# Altium schematic sheet DDRC_Sheet_2.SchDoc
size A4; DocumentNumber: 10; SheetNumber: 10; SheetTotal: 27
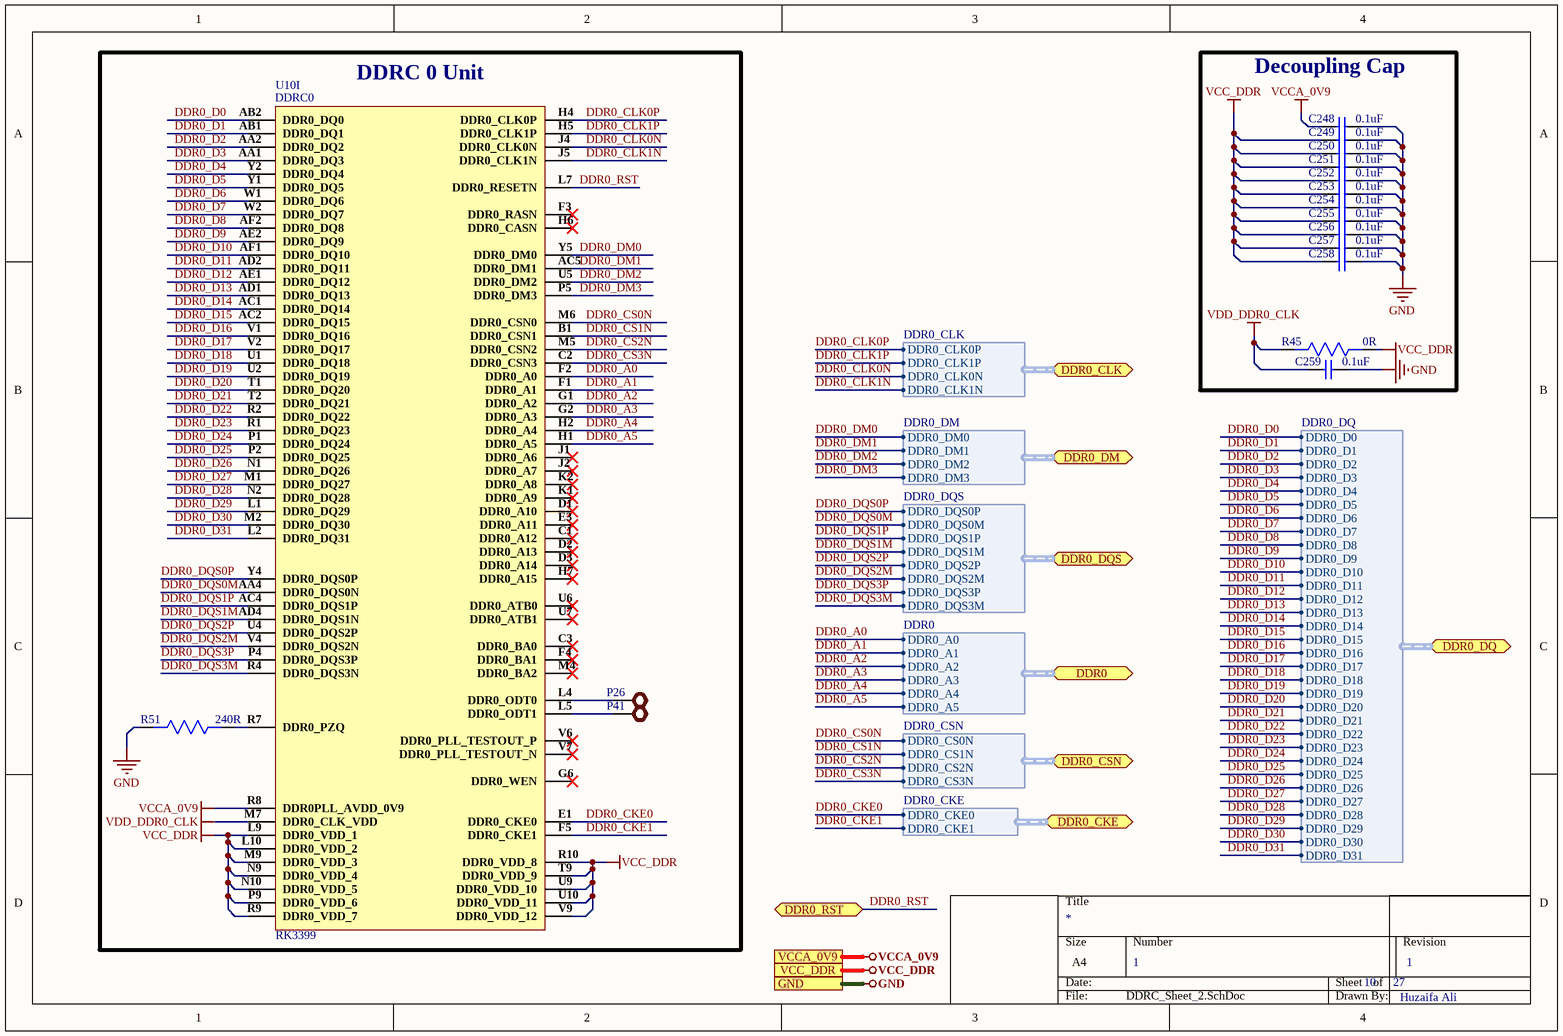
[diagram p0: DDRC_Sheet_2.SchDoc]

## Parts
C248  0.1uF  [Cap0402]
C249  0.1uF  [Cap0402]
C250  0.1uF  [Cap0402]
C251  0.1uF  [Cap0402]
C252  0.1uF  [Cap0402]
C253  0.1uF  [Cap0402]
C254  0.1uF  [Cap0402]
C255  0.1uF  [Cap0402]
C256  0.1uF  [Cap0402]
C257  0.1uF  [Cap0402]
C258  0.1uF  [Cap0402]
C259  0.1uF  [Cap0402]
P26  TEST POINT  [TEST POINT]  (value not drawn)
P41  TEST POINT  [TEST POINT]  (value not drawn)
R45  0R  [Res0603]
R51  240R  [Res0603]
U10  RK3399  [RK3399]  (part I of 34)

## Blocks framed on the sheet
DDRC 0 Unit: P26 P41 R51 U10
Decoupling Cap: C248-C259 R45

## Ports
DDR0 (bidir, harness DDR0), DDR0_CKE (bidir, harness DDR0_CKE), DDR0_CLK (bidir, harness DDR0_CLK), DDR0_CSN (bidir, harness DDR0_CSN), DDR0_DM (bidir, harness DDR0_DM), DDR0_DQ (bidir, harness DDR0_DQ), DDR0_DQS (bidir, harness DDR0_DQS), DDR0_RST (bidir), GND, VCC_DDR, VCCA_0V9

## Harnesses
DDR0_DQ: DDR0_D0, DDR0_D1, DDR0_D2, DDR0_D3, DDR0_D4, DDR0_D5, DDR0_D6, DDR0_D7, DDR0_D8, DDR0_D9, DDR0_D10, DDR0_D11, DDR0_D12, DDR0_D13, DDR0_D14, DDR0_D15, DDR0_D16, DDR0_D17, DDR0_D18, DDR0_D19, DDR0_D20, DDR0_D21, DDR0_D22, DDR0_D23, DDR0_D24, DDR0_D25, DDR0_D26, DDR0_D27, DDR0_D28, DDR0_D29, DDR0_D30, DDR0_D31
DDR0_DM: DDR0_DM0, DDR0_DM1, DDR0_DM2, DDR0_DM3
DDR0_DQS: DDR0_DQS0P, DDR0_DQS0M, DDR0_DQS1P, DDR0_DQS1M, DDR0_DQS2P, DDR0_DQS2M, DDR0_DQS3P, DDR0_DQS3M
DDR0: DDR0_A0, DDR0_A1, DDR0_A2, DDR0_A3, DDR0_A4, DDR0_A5
DDR0_CSN: DDR0_CS0N, DDR0_CS1N, DDR0_CS2N, DDR0_CS3N
DDR0_CKE: DDR0_CKE0, DDR0_CKE1
DDR0_CLK: DDR0_CLK0P, DDR0_CLK1P, DDR0_CLK0N, DDR0_CLK1N

## Nets
GND: C248.2 C249.2 C250.2 C251.2 C252.2 C253.2 C254.2 C255.2 C256.2 C257.2 C258.2 C259.2 R51.2 ; port GND
VCC_DDR: C249.1 C250.1 C251.1 C252.1 C253.1 C254.1 C255.1 C256.1 C257.1 C258.1 R45.1 U10.L9(DDR0_VDD_1) U10.L10(DDR0_VDD_2) U10.M9(DDR0_VDD_3) U10.N9(DDR0_VDD_4) U10.N10(DDR0_VDD_5) U10.P9(DDR0_VDD_6) U10.R9(DDR0_VDD_7) U10.R10(DDR0_VDD_8) U10.T9(DDR0_VDD_9) U10.U9(DDR0_VDD_10) U10.U10(DDR0_VDD_11) U10.V9(DDR0_VDD_12) ; port VCC_DDR
VCCA_0V9: C248.1 U10.R8(DDR0PLL_AVDD_0V9) ; port VCCA_0V9
VDD_DDR0_CLK: C259.1 R45.2 U10.M7(DDR0_CLK_VDD)
DDR0_A0: U10.F2(DDR0_A0) ; port DDR0.DDR0_A0
DDR0_A1: U10.F1(DDR0_A1) ; port DDR0.DDR0_A1
DDR0_A2: U10.G1(DDR0_A2) ; port DDR0.DDR0_A2
DDR0_A3: U10.G2(DDR0_A3) ; port DDR0.DDR0_A3
DDR0_A4: U10.H2(DDR0_A4) ; port DDR0.DDR0_A4
DDR0_A5: U10.H1(DDR0_A5) ; port DDR0.DDR0_A5
DDR0_CKE0: U10.E1(DDR0_CKE0) ; port DDR0_CKE.DDR0_CKE0
DDR0_CKE1: U10.F5(DDR0_CKE1) ; port DDR0_CKE.DDR0_CKE1
DDR0_CLK0N: U10.J4(DDR0_CLK0N) ; port DDR0_CLK.DDR0_CLK0N
DDR0_CLK0P: U10.H4(DDR0_CLK0P) ; port DDR0_CLK.DDR0_CLK0P
DDR0_CLK1N: U10.J5(DDR0_CLK1N) ; port DDR0_CLK.DDR0_CLK1N
DDR0_CLK1P: U10.H5(DDR0_CLK1P) ; port DDR0_CLK.DDR0_CLK1P
DDR0_CS0N: U10.M6(DDR0_CSN0) ; port DDR0_CSN.DDR0_CS0N
DDR0_CS1N: U10.B1(DDR0_CSN1) ; port DDR0_CSN.DDR0_CS1N
DDR0_CS2N: U10.M5(DDR0_CSN2) ; port DDR0_CSN.DDR0_CS2N
DDR0_CS3N: U10.C2(DDR0_CSN3) ; port DDR0_CSN.DDR0_CS3N
DDR0_D0: U10.AB2(DDR0_DQ0) ; port DDR0_DQ.DDR0_D0
DDR0_D1: U10.AB1(DDR0_DQ1) ; port DDR0_DQ.DDR0_D1
DDR0_D2: U10.AA2(DDR0_DQ2) ; port DDR0_DQ.DDR0_D2
DDR0_D3: U10.AA1(DDR0_DQ3) ; port DDR0_DQ.DDR0_D3
DDR0_D4: U10.Y2(DDR0_DQ4) ; port DDR0_DQ.DDR0_D4
DDR0_D5: U10.Y1(DDR0_DQ5) ; port DDR0_DQ.DDR0_D5
DDR0_D6: U10.W1(DDR0_DQ6) ; port DDR0_DQ.DDR0_D6
DDR0_D7: U10.W2(DDR0_DQ7) ; port DDR0_DQ.DDR0_D7
DDR0_D8: U10.AF2(DDR0_DQ8) ; port DDR0_DQ.DDR0_D8
DDR0_D9: U10.AE2(DDR0_DQ9) ; port DDR0_DQ.DDR0_D9
DDR0_D10: U10.AF1(DDR0_DQ10) ; port DDR0_DQ.DDR0_D10
DDR0_D11: U10.AD2(DDR0_DQ11) ; port DDR0_DQ.DDR0_D11
DDR0_D12: U10.AE1(DDR0_DQ12) ; port DDR0_DQ.DDR0_D12
DDR0_D13: U10.AD1(DDR0_DQ13) ; port DDR0_DQ.DDR0_D13
DDR0_D14: U10.AC1(DDR0_DQ14) ; port DDR0_DQ.DDR0_D14
DDR0_D15: U10.AC2(DDR0_DQ15) ; port DDR0_DQ.DDR0_D15
DDR0_D16: U10.V1(DDR0_DQ16) ; port DDR0_DQ.DDR0_D16
DDR0_D17: U10.V2(DDR0_DQ17) ; port DDR0_DQ.DDR0_D17
DDR0_D18: U10.U1(DDR0_DQ18) ; port DDR0_DQ.DDR0_D18
DDR0_D19: U10.U2(DDR0_DQ19) ; port DDR0_DQ.DDR0_D19
DDR0_D20: U10.T1(DDR0_DQ20) ; port DDR0_DQ.DDR0_D20
DDR0_D21: U10.T2(DDR0_DQ21) ; port DDR0_DQ.DDR0_D21
DDR0_D22: U10.R2(DDR0_DQ22) ; port DDR0_DQ.DDR0_D22
DDR0_D23: U10.R1(DDR0_DQ23) ; port DDR0_DQ.DDR0_D23
DDR0_D24: U10.P1(DDR0_DQ24) ; port DDR0_DQ.DDR0_D24
DDR0_D25: U10.P2(DDR0_DQ25) ; port DDR0_DQ.DDR0_D25
DDR0_D26: U10.N1(DDR0_DQ26) ; port DDR0_DQ.DDR0_D26
DDR0_D27: U10.M1(DDR0_DQ27) ; port DDR0_DQ.DDR0_D27
DDR0_D28: U10.N2(DDR0_DQ28) ; port DDR0_DQ.DDR0_D28
DDR0_D29: U10.L1(DDR0_DQ29) ; port DDR0_DQ.DDR0_D29
DDR0_D30: U10.M2(DDR0_DQ30) ; port DDR0_DQ.DDR0_D30
DDR0_D31: U10.L2(DDR0_DQ31) ; port DDR0_DQ.DDR0_D31
DDR0_DM0: U10.Y5(DDR0_DM0) ; port DDR0_DM.DDR0_DM0
DDR0_DM1: U10.AC5(DDR0_DM1) ; port DDR0_DM.DDR0_DM1
DDR0_DM2: U10.U5(DDR0_DM2) ; port DDR0_DM.DDR0_DM2
DDR0_DM3: U10.P5(DDR0_DM3) ; port DDR0_DM.DDR0_DM3
DDR0_DQS0M: U10.AA4(DDR0_DQS0N) ; port DDR0_DQS.DDR0_DQS0M
DDR0_DQS0P: U10.Y4(DDR0_DQS0P) ; port DDR0_DQS.DDR0_DQS0P
DDR0_DQS1M: U10.AD4(DDR0_DQS1N) ; port DDR0_DQS.DDR0_DQS1M
DDR0_DQS1P: U10.AC4(DDR0_DQS1P) ; port DDR0_DQS.DDR0_DQS1P
DDR0_DQS2M: U10.V4(DDR0_DQS2N) ; port DDR0_DQS.DDR0_DQS2M
DDR0_DQS2P: U10.U4(DDR0_DQS2P) ; port DDR0_DQS.DDR0_DQS2P
DDR0_DQS3M: U10.R4(DDR0_DQS3N) ; port DDR0_DQS.DDR0_DQS3M
DDR0_DQS3P: U10.P4(DDR0_DQS3P) ; port DDR0_DQS.DDR0_DQS3P
DDR0_RST: U10.L7(DDR0_RESETN) ; port DDR0_RST
NetP26_1: P26.1 U10.L4(DDR0_ODT0)
NetP41_1: P41.1 U10.L5(DDR0_ODT1)
NetR51_1: R51.1 U10.R7(DDR0_PZQ)

Not connected (* = marked no-connect by the designer): U10 C1(DDR0_A12)* C3(DDR0_BA0)* D1(DDR0_A10)* D2(DDR0_A13)* D3(DDR0_A14)* E3(DDR0_A11)* F3(DDR0_RASN)* F4(DDR0_BA1)* G6(DDR0_WEN)* H6(DDR0_CASN)* H7(DDR0_A15)* J1(DDR0_A6)* J2(DDR0_A7)* K1(DDR0_A9)* K2(DDR0_A8)* M4(DDR0_BA2)* U6(DDR0_ATB0)* U7(DDR0_ATB1)* V6(DDR0_PLL_TESTOUT_P)* V7(DDR0_PLL_TESTOUT_N)*

## Notes on the sheet
- 1
- Huzaifa Ali
- (in symbol RK3399, part I) DDRC0

## Library data of the parts
C248-C259 = CC0402KRX5R6BB104: CAP CER 0.1UF 10V X5R 0402; Manufacturer: Yageo; Capacitance: 100nF; Tolerance: 10%; Dissipation Factor: 5%; Insulation Resistance: 10GR; Supplier 1: Digi-Key; Manufacturer Part Number: CC0402KRX5R6BB104; RoHS: Yes; Category: Ceramic Capacitors; Stock 1: 6385580; Pricing 1: 1=0.10000, 10=0.02700, 50=0.01500, 100=0.01220, 500=0.00874, 1000=0.00687, 2500=0.00625, 5000=0.00575 (USD); Mount: Surface Mount; Case/Package: 0402; Number of Pins: 2; Case Code (Imperial): 0402; Case Code (Metric): 1005; Min Operating Temperature: -55°C; Max Operating Temperature: 85°C; Dielectric: X5R; Packaging: Tape and Reel; Voltage Rating: 10V; Package Quantity: 1; Termination: SMD/SMT; Voltage Rating (DC): 10V; Series: CC; Length: 1mm; Width: 0.02inch; Height: 0.5mm; Depth: 0.5mm; Thickness: 0.022inch; Radiation Hardening: No; RoHS Compliant: Yes; REACH SVHC: No SVHC; Lead Free: Lead Free; Halogen Free: Halogen Free; ComponentLink1URL: https://datasheet.ciiva.com/144/mlccorderingcode-144029.pdf?src-supplier=Digi-Key; ComponentLink1Description: https://datasheet.ciiva.com/144/mlccorderingcode-144029.pdf?src-supplier=Digi-Key; ComponentLink2URL: https://datasheet.ciiva.com/144/mlccorderingcode-144028.pdf?src-supplier=Digi-Key; ComponentLink2Description: https://datasheet.ciiva.com/144/mlccorderingcode-144028.pdf?src-supplier=Digi-Key; ComponentLink3URL: https://datasheet.ciiva.com/144/mlccorderingcode-144030.pdf?src-supplier=Digi-Key; ComponentLink3Description: https://datasheet.ciiva.com/144/mlccorderingcode-144030.pdf?src-supplier=Digi-Key; ComponentLink4URL: https://datasheet.ciiva.com/7978/1359354-7978091.pdf?src-supplier=Element14; ComponentLink4Description: https://datasheet.ciiva.com/7978/1359354-7978091.pdf?src-supplier=Element14; ComponentLink5URL: https://datasheet.ciiva.com/11587/upy-gphc-x5r-4v-to-50v-12-11587302.pdf?src-supplier=Avnet; ComponentLink5Description: https://datasheet.ciiva.com/11587/upy-gphc-x5r-4v-to-50v-12-11587302.pdf?src-supplier=Avnet; Supplier Part Number 1: 311-1336-1-ND
P26 P41 = TEST POINT: Test Point ON
R45 = RC0603FR-070RL: RES SMD 0R, 1%, 0.1W, 0603; Manufacturer: Yageo; Resistance: 0mR; Power Rating: 100mW; Voltage Rating (DC): 50V; Temperature Coefficient: 200ppm/°C; Current Rating: 1A; Working Voltage: 75V; Supplier 1: Arrow Electronics; Manufacturer Part Number: RC0603FR-070RL; RoHS: Yes; Category: Chip SMD Resistors; Stock 1: 1270000; Pricing 1: 5000=0.00320, 5000=0.00490, 50000=0.00450, 500000=0.00250, 2500000=0.00150 (USD); Case/Package: 0603; Number of Pins: 2; Contact Plating: Tin,Matte; Case Code (Metric): 1608; Case Code (Imperial): 0603; Min Operating Temperature: -55°C; Max Operating Temperature: 155°C; Resistor Type: Thick Film; Packaging: Tape and Reel; Tolerance: 1%; Package Quantity: 5000; Voltage Rating: 50V; Number of Terminations: 2; Termination: SMD/SMT; Max Power Dissipation: 100mW; Features: Moisture Resistant; Length: 1.6mm; Width: 0.031inch; Height: 0.45mm; Depth: 0.8mm; Radiation Hardening: No; REACH SVHC: No SVHC; Lead Free: Lead Free; Military Standard: Not; ComponentLink1URL: https://datasheet.ciiva.com/11808/0900766b80f96399-11808172.pdf?src-supplier=RSComponents; ComponentLink1Description: https://datasheet.ciiva.com/11808/0900766b80f96399-11808172.pdf?src-supplier=RSComponents; ComponentLink2URL: https://datasheet.ciiva.com/5558/rc0603-272842-5558341.pdf?src-supplier=Mouser; ComponentLink2Description: https://datasheet.ciiva.com/5558/rc0603-272842-5558341.pdf?src-supplier=Mouser; ComponentLink3URL: https://datasheet.ciiva.com/46382/443971-46382072.pdf?src-supplier=Element14; ComponentLink3Description: https://datasheet.ciiva.com/46382/443971-46382072.pdf?src-supplier=Element14; ComponentLink4URL: https://datasheet.ciiva.com/29721/pyu-r-int-thick-7-29721178.pdf?src-supplier=Digi-Key; ComponentLink4Description: https://datasheet.ciiva.com/29721/pyu-r-int-thick-7-29721178.pdf?src-supplier=Digi-Key; ComponentLink5URL: https://datasheet.ciiva.com/5684/443971-5684699.pdf?src-supplier=Farnell; ComponentLink5Description: https://datasheet.ciiva.com/5684/443971-5684699.pdf?src-supplier=Farnell; ComponentLink6URL: https://datasheet.ciiva.com/7983/443971-7983627.pdf?src-supplier=Element14; ComponentLink6Description: https://datasheet.ciiva.com/7983/443971-7983627.pdf?src-supplier=Element14; ComponentLink7URL: https://datasheet.ciiva.com/29721/pyu-rc0603-51-rohs-l-4-29721179.pdf?src-supplier=Digi-Key; ComponentLink7Description: https://datasheet.ciiva.com/29721/pyu-rc0603-51-rohs-l-4-29721179.pdf?src-supplier=Digi-Key; ComponentLink8URL: https://datasheet.ciiva.com/22643/1868787-22643388.pdf?src-supplier=Element14; ComponentLink8Description: https://datasheet.ciiva.com/22643/1868787-22643388.pdf?src-supplier=Element14; Supplier Part Number 1: RC0603FR-070RL
R51 = RT0603BRD07240RL: RES SMD 240 OHM 0.1% 1/10W 0603; Manufacturer: Yageo; Power Rating: 100mW; Voltage Rating: 75V; Temperature Coefficient: 25ppm/°C; Voltage Rating (DC): 50V; Supplier 1: Arrow Electronics; Manufacturer Part Number: RT0603BRD07240RL; RoHS: Yes; Category: Chip SMD Resistors; Stock 1: 5; Pricing 1: 1=0.13940 (USD); Case/Package: 0603; Case Code (Imperial): 0603; Case Code (Metric): 1608; Contact Plating: Tin,Matte; Min Operating Temperature: -55°C; Max Operating Temperature: 125°C; Resistance: 240R; Tolerance: 0.1%; Packaging: Tape and Reel; Resistor Type: Thin Film; Number of Terminations: 2; Termination: SMD/SMT; Max Power Dissipation: 100mW; Features: Moisture Resistant; Series: RT; Construction: Rectangular; Length: 1.6mm; Width: 0.031inch; Height: 0.022inch; Depth: 0.8mm; Radiation Hardening: No; Military Standard: Not; Lead Free: Lead Free; RoHS Compliant: Yes; ComponentLink1URL: https://datasheet.ciiva.com/8886/pyu-rt-1-to-0-05-rohs-l-4-8886602.pdf?src-supplier=Avnet; ComponentLink1Description: https://datasheet.ciiva.com/8886/pyu-rt-1-to-0-05-rohs-l-4-8886602.pdf?src-supplier=Avnet; ComponentLink2URL: https://datasheet.ciiva.com/12799/pyu-rt-1-to-0-05-rohs-l-4-12799039.pdf?src-supplier=Mouser; ComponentLink2Description: https://datasheet.ciiva.com/12799/pyu-rt-1-to-0-05-rohs-l-4-12799039.pdf?src-supplier=Mouser; Supplier Part Number 1: RT0603BRD07240RL
U10 = RK3399: RK3399 CPU BGA for HD set-top box chip BGA Chipse; Manufacturer: Fuzhou Rockchip Electronics; ComponentLink1Description: Aliexpress; ComponentLink1URL: https://www.aliexpress.com/item/1005001971093459.html?spm=a2g0n.productlist.0.0.3c7csv8Qsv8Quh&browser_id=3ac7e9efb8074641aaabc4d871f09748&aff_trace_key=&aff_platform=msite&m_page_id=181389a08711fc2600d8cc522bab8d702dd4189be0&gclid=&pdp_npi=2%40dis%21USD%21%2123.6%21%21%21%21%21%402101d91e16545120399167831e8b89%21%21sea&algo_pvid=4303aedd-774c-4013-953d-920f10b55003; Manufacturer Part Number: RK3399; Footprint: FCBGA828